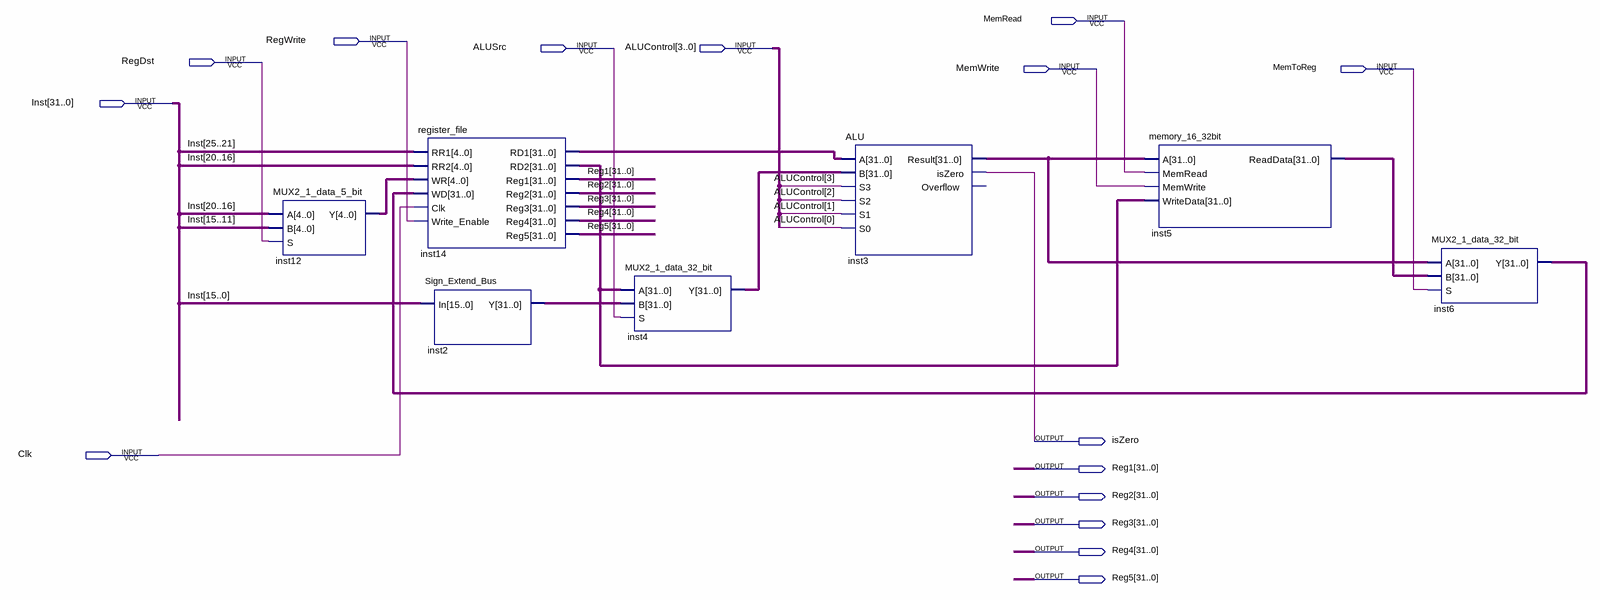
[diagram p0: schematic sheet]
// Quartus schematic Datapath.bdf as structural Verilog: 7 symbols, 15 pins
module Datapath (
  input  MemRead,
  input  RegWrite,
  input  ALUSrc,
  input  [3:0] ALUControl,
  input  RegDst,
  input  MemWrite,
  input  MemToReg,
  input  [31:0] Inst,
  input  Clk,
  output isZero,
  output [31:0] Reg1,
  output [31:0] Reg2,
  output [31:0] Reg3,
  output [31:0] Reg4,
  output [31:0] Reg5
);

  wire [4:0] inst12_y;
  wire [31:0] inst2_y, inst3_result, inst4_y, inst5_readdata, inst6_y, inst14_rd1, inst14_rd2;

  MUX2_1_data_5_bit inst12 (.A(Inst[20:16]), .B(Inst[15:11]), .S(RegDst), .Y(inst12_y));
  register_file inst14 (
    .WD(inst6_y), .RR1(Inst[25:21]), .RR2(Inst[20:16]), .WR(inst12_y), .Clk(Clk), .Write_Enable(RegWrite),
    .RD1(inst14_rd1), .RD2(inst14_rd2), .Reg1(Reg1), .Reg2(Reg2), .Reg3(Reg3), .Reg4(Reg4), .Reg5(Reg5));
  Sign_Extend_Bus inst2 (.In(Inst[15:0]), .Y(inst2_y));
  MUX2_1_data_32_bit inst4 (.A(inst14_rd2), .B(inst2_y), .S(ALUSrc), .Y(inst4_y));
  ALU inst3 (
    .A(inst14_rd1), .B(inst4_y), .S3(ALUControl[3]), .S2(ALUControl[2]), .S1(ALUControl[1]),
    .S0(ALUControl[0]), .Result(inst3_result), .isZero(isZero));  // open: Overflow
  memory_16_32bit inst5 (
    .WriteData(inst14_rd2), .A(inst3_result), .MemRead(MemRead), .MemWrite(MemWrite),
    .ReadData(inst5_readdata));
  MUX2_1_data_32_bit inst6 (.A(inst3_result), .B(inst5_readdata), .S(MemToReg), .Y(inst6_y));
endmodule
